# Altium project slots.PrjPcb
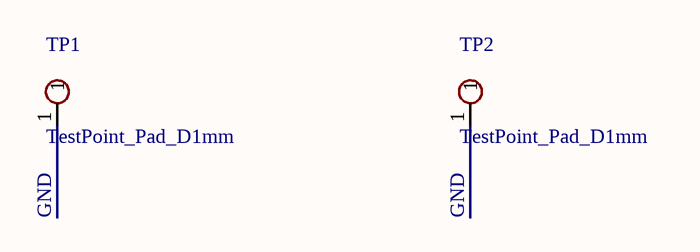
[diagram p0: slots.SchDoc]
1 sheet, 2 parts. Net scope: global (net labels, ports and power ports of the same name join across sheets).
Board file: slots.PcbDoc

## Sheet slots.SchDoc
size A4

### Parts
TP1  TestPoint_Pad_D1mm  [TestPoint_Pad_D1mm]
TP2  TestPoint_Pad_D1mm  [TestPoint_Pad_D1mm]

### Nets
GND: TP1.1 TP2.1

### Library data of the parts
TP1 TP2 = TestPoint